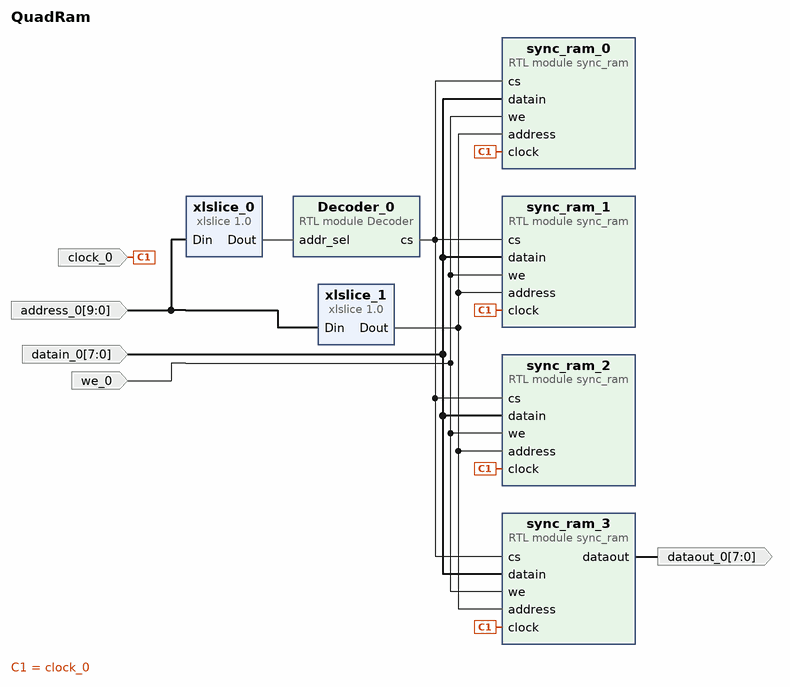
[diagram p0: block diagram of the top level]
# Vivado block design QuadRam, xc7a200tfbg676-2, Vivado 2025.1
create_bd_design QuadRam

create_bd_port -dir I -type clk clock_0
create_bd_port -dir I we_0
create_bd_port -dir I -from 9 -to 0 address_0
create_bd_port -dir I -from 7 -to 0 datain_0
create_bd_port -dir O -from 7 -to 0 dataout_0

create_bd_cell -type module -reference sync_ram sync_ram_0
set_property -dict {CONFIG.ADDR_LENGHT 8} [get_bd_cells sync_ram_0]
create_bd_cell -type module -reference sync_ram sync_ram_1
set_property -dict {CONFIG.ADDR_LENGHT 8} [get_bd_cells sync_ram_1]
create_bd_cell -type module -reference sync_ram sync_ram_2
set_property -dict {CONFIG.ADDR_LENGHT 8} [get_bd_cells sync_ram_2]
create_bd_cell -type module -reference sync_ram sync_ram_3
set_property -dict {CONFIG.ADDR_LENGHT 8} [get_bd_cells sync_ram_3]
create_bd_cell -type module -reference Decoder Decoder_0
create_bd_cell -type ip -vlnv xilinx.com:ip:xlslice:1.0 xlslice_0
set_property -dict {CONFIG.DIN_FROM 9 CONFIG.DIN_TO 8 CONFIG.DIN_WIDTH 10 CONFIG.DOUT_WIDTH 2} [get_bd_cells xlslice_0]
create_bd_cell -type ip -vlnv xilinx.com:ip:xlslice:1.0 xlslice_1
set_property -dict {CONFIG.DIN_FROM 7 CONFIG.DIN_TO 0 CONFIG.DIN_WIDTH 10 CONFIG.DOUT_WIDTH 8} [get_bd_cells xlslice_1]

# ---- connections ----

connect_bd_net [get_bd_pins Decoder_0/cs] \
  [get_bd_pins sync_ram_0/cs] [get_bd_pins sync_ram_1/cs] [get_bd_pins sync_ram_2/cs] [get_bd_pins sync_ram_3/cs]
connect_bd_net -net address_0_1 [get_bd_ports address_0] [get_bd_pins xlslice_0/Din] [get_bd_pins xlslice_1/Din]
connect_bd_net -net clock_0_1 [get_bd_ports clock_0] \
  [get_bd_pins sync_ram_1/clock] [get_bd_pins sync_ram_2/clock] [get_bd_pins sync_ram_3/clock] [get_bd_pins sync_ram_0/clock]
connect_bd_net -net datain_0_1 [get_bd_ports datain_0] \
  [get_bd_pins sync_ram_0/datain] [get_bd_pins sync_ram_1/datain] [get_bd_pins sync_ram_2/datain] \
  [get_bd_pins sync_ram_3/datain]
connect_bd_net [get_bd_pins sync_ram_3/dataout] [get_bd_ports dataout_0]
connect_bd_net -net we_0_1 [get_bd_ports we_0] \
  [get_bd_pins sync_ram_0/we] [get_bd_pins sync_ram_1/we] [get_bd_pins sync_ram_2/we] [get_bd_pins sync_ram_3/we]
connect_bd_net [get_bd_pins xlslice_0/Dout] [get_bd_pins Decoder_0/addr_sel]
connect_bd_net [get_bd_pins xlslice_1/Dout] \
  [get_bd_pins sync_ram_0/address] [get_bd_pins sync_ram_1/address] [get_bd_pins sync_ram_3/address] \
  [get_bd_pins sync_ram_2/address]

validate_bd_design
save_bd_design
